# Altium schematic sheet 01_Alimentacion.SchDoc: Portable_Guitar_MultiFX
size A4; Organization: Altium Limited; Address1: L3, 12a Rodborough Rd; Address2: Frenchs Forest; Address3: NSW; Address4: Australia 2086; DocumentNumber: 1; Revision: 1.0; SheetNumber: 2; SheetTotal: 5
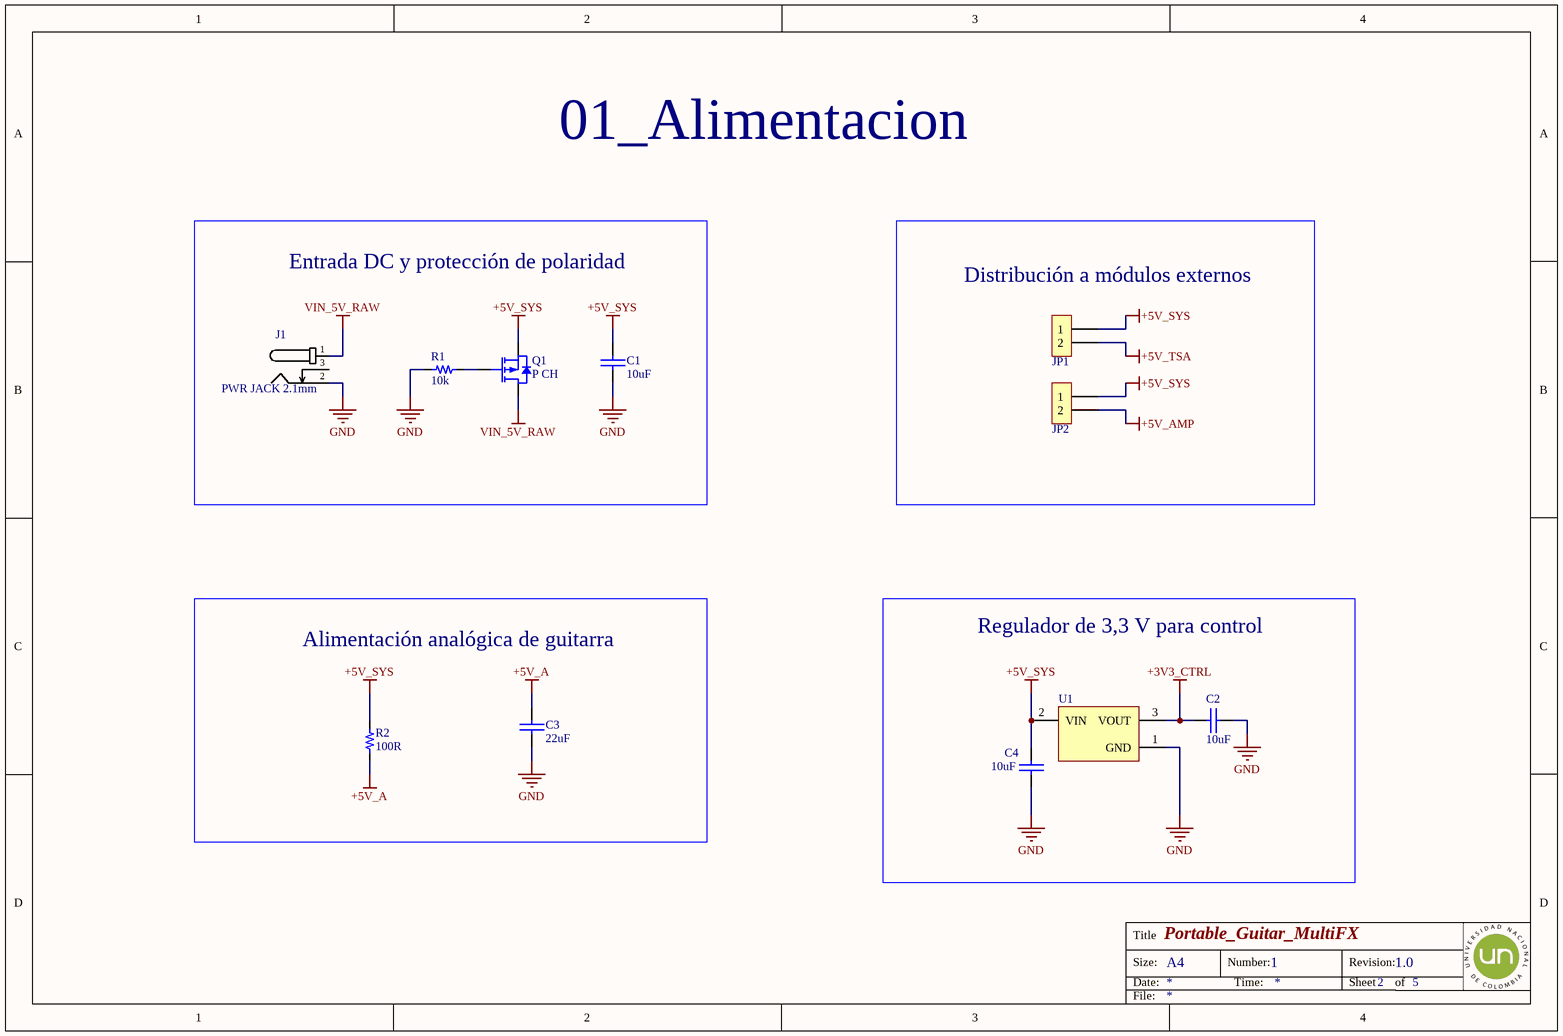
[diagram p0: 01_Alimentacion.SchDoc]

## Parts
C1  value 10uF  [0805_cap]  (hidden comment: 10uF 25V)
C2  value 10uF  [0805_cap]  (hidden comment: 10uF 25V)
C3  value 22uF  [0805_cap]  (hidden comment: 22uF 16V)
C4  value 10uF  [0805_cap]  (hidden comment: 10uF 25V)
J1  PWR JACK 2.1mm  [CON_POWER_BARREL_2.1MM_3CONN]
JP1  2x1  [H_2x1_TH_100mil]  (value not drawn)  (no BOM)
JP2  2x1  [H_2x1_TH_100mil]  (value not drawn)  (no BOM)
Q1  P CH  [SOT_23_3]
R1  value 10k  [0603_res]  (hidden comment: 10k 1/10W)
R2  value 100R  [0603_res]  (hidden comment: 100R 1/10W)
U1  MCP1700-3302E/TO  [TO-92-TO3]  (value not drawn)

## Blocks framed on the sheet
Entrada DC y protección de polaridad: C1 J1 Q1 R1
Distribución a módulos externos: JP1 JP2
Alimentación analógica de guitarra: C3 R2
Regulador de 3,3 V para control: C2 C4 U1

## Nets
+3V3_CTRL: C2.2 U1.3(VOUT)
+5V_A: C3.1 R2.1
+5V_AMP: JP2.2
+5V_SYS: C1.1 C4.2 JP1.1 JP2.1 Q1.2(S) R2.2 U1.2(VIN)
+5V_TSA: JP1.2
GND: C1.2 C2.1 C3.2 C4.1 J1.2 R1.1 U1.1(GND)
VIN_5V_RAW: J1.1 Q1.3(D)
NetQ1_1: Q1.1(G) R1.2

Not connected (* = marked no-connect by the designer): J1 3

## Notes on the sheet
- 01_Alimentacion
- Title
- Size:
- Date:
- A4
- Number:
- Time:
- Revision:
- Sheet
- of
- File:

## Library data of the parts
C1 C2 C4 = Cap_10uF_0805_25V_: 25V 10uF X5R ±10% 0805 Multilayer Ceramic Capacitors MLCC - SMD/SMT ROHS; Manufacturer: Samsung Electro-Mechanics; Manufacturer Part Number: CL21A106KAYNNNE; Supplier 1: LCSC; Supplier Part Number 1: C15850; ComponentLink1Description: LCSC; ComponentLink1URL: https://lcsc.com/product-detail/Multilayer-Ceramic-Capacitors-MLCC-SMD-SMT_Samsung-Electro-Mechanics-CL21A106KAYNNNE_C15850.html
C3 = Cap_22uF_0805_16V: 16V 22uF X5R ±20% 0805 Multilayer Ceramic Capacitors MLCC - SMD/SMT ROHS; Manufacturer: Chinocera; Manufacturer Part Number: HGC0805R5226M160NSLJ; Supplier 1: LCSC; Supplier Part Number 1: C33546008; ComponentLink1Description: LCSC; ComponentLink1URL: https://lcsc.com/product-detail/Multilayer-Ceramic-Capacitors-MLCC-SMD-SMT_Chinocera-HGC0805R5226M160NSLJ_C33546008.html
J1 = Con_Power_Jack_2.1mm_3pins: CONN PWR JACK 2X5.5MM SOLDER; Manufacturer: HCTL; Manufacturer Part Number: HC-DC-005-2.0T; Supplier 1: LCSC; Supplier Part Number 1: C3010533; ComponentLink1Description: LCSC; ComponentLink1URL: https://www.lcsc.com/product-detail/AC-DC-Power-Connectors_HCTL-HC-DC-005-2-0T_C3010533.html
JP1 JP2 = H_Male_2x1_TH_100mil: ComponentLink1Description: LCSC
Q1 = Q_PFET_30V_3A_SOT23: MOSFET P-CH 20V 3A SOT23; Manufacturer: ALLPOWER(ShenZhen Quan Li Semiconductor); Manufacturer Part Number: AP2301; Supplier 1: LCSC; Supplier Part Number 1: C385296; ComponentLink1Description: LCSC; ComponentLink1URL: https://www.lcsc.com/product-detail/MOSFETs_ALLPOWER-ShenZhen-Quan-Li-Semiconductor-AP2301_C385296.html
R1 = Res_10k_0603_1/10W: RES SMD 10k OHM 5% 1/10W 0603; Manufacturer: FOJAN; Manufacturer Part Number: FRC0603J103TS; ComponentLink1URL: https://www.lcsc.com/product-detail/Chip-Resistor-Surface-Mount_FOJAN-FRC0603J103TS_C2930027.html; Supplier 1: LCSC; Supplier Part Number 1: C2930027; ComponentLink1Description: LCSC
R2 = Res_100R_0603_1/10W: RES SMD 100R OHM 5% 1/10W 0603; Manufacturer: FOJAN; Manufacturer Part Number: FRC0603J101 TS; ComponentLink1URL: https://www.lcsc.com/product-detail/Chip-Resistor-Surface-Mount_FOJAN-FRC0603J101-TS_C2907089.html; Supplier 1: LCSC; Supplier Part Number 1: C2907089; ComponentLink1Description: LCSC
U1 = CMP-0136-00007-1: Low Quiescent Current LDO, 3-Pin TO-92, Extended TemperatureBAG; PackageReference: TO-92-TO3; PackageDescription: 3-Lead Plastic Transistor Outline (TO) [TO-92]; DatasheetVersion: revB, Feb-2007; PackageVersion: revBB, Aug-2009